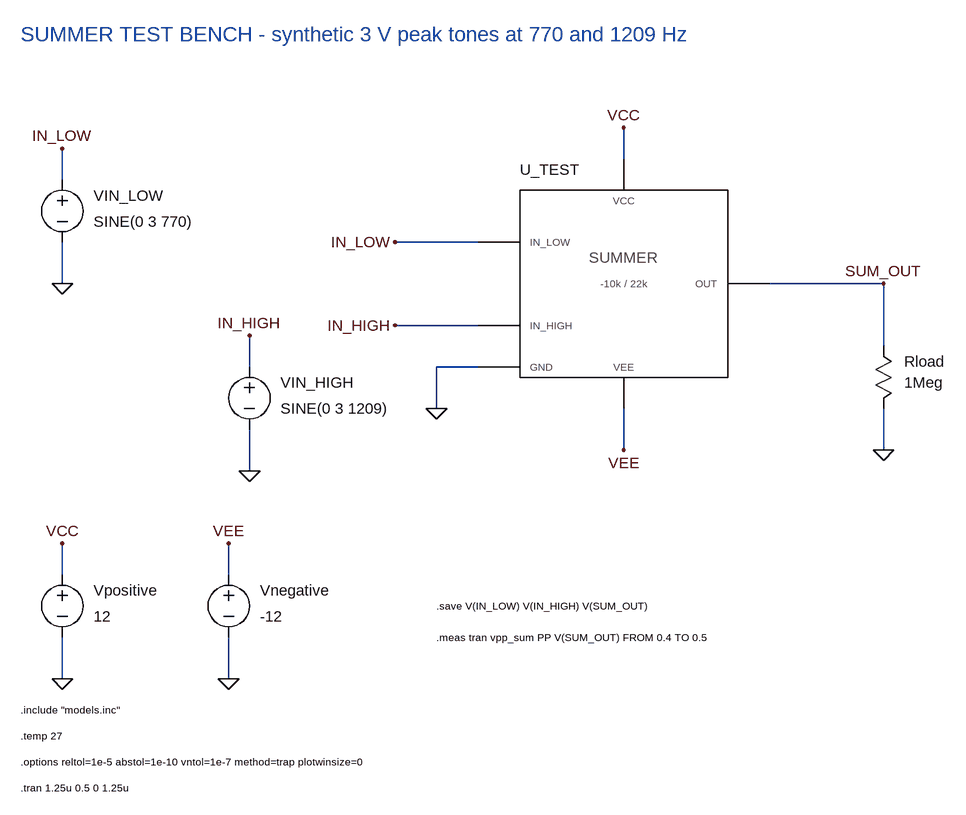
[diagram p0: schematic Test_SummingAmplifier.asc]
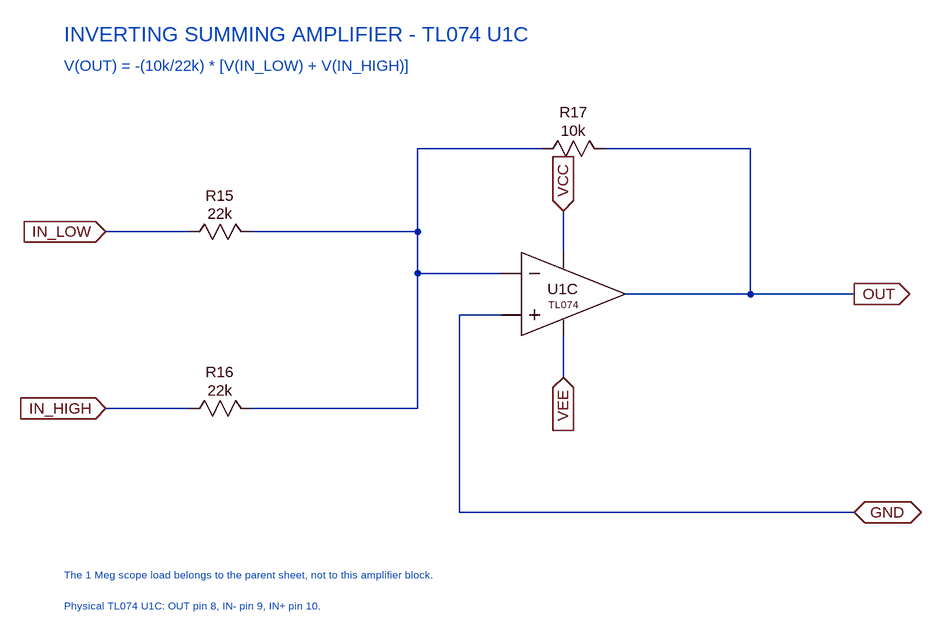
[diagram p1: sub-circuit summingamplifier.asc]
Test_SummingAmplifier.asc, the LTspice schematic file:
Version 4
SHEET 1 1856 1248
WIRE 992 208 992 160
WIRE 992 592 992 656
WIRE 768 528 704 528
WIRE 704 528 704 592
WIRE 128 240 128 192
WIRE 128 336 128 400
WIRE 416 528 416 480
WIRE 416 624 416 688
WIRE 768 336 640 336
WIRE 768 464 640 464
WIRE 1216 400 1392 400
WIRE 1392 400 1392 496
WIRE 1392 592 1392 656
WIRE 128 848 128 800
WIRE 128 944 128 1008
WIRE 384 848 384 800
WIRE 384 944 384 1008
FLAG 992 160 VCC
FLAG 992 656 VEE
FLAG 704 592 0
FLAG 128 192 IN_LOW
FLAG 128 400 0
FLAG 416 480 IN_HIGH
FLAG 416 688 0
FLAG 640 336 IN_LOW
FLAG 640 464 IN_HIGH
FLAG 1392 400 SUM_OUT
FLAG 1392 656 0
FLAG 128 800 VCC
FLAG 128 1008 0
FLAG 384 800 VEE
FLAG 384 1008 0
SYMBOL SummingAmplifier 832 256 R0
SYMATTR InstName U_TEST
SYMBOL V_Source 128 240 R0
SYMATTR InstName VIN_LOW
SYMATTR Value SINE(0 3 770)
SYMBOL V_Source 416 528 R0
SYMATTR InstName VIN_HIGH
SYMATTR Value SINE(0 3 1209)
SYMBOL R_V 1392 496 R0
SYMATTR InstName Rload
SYMATTR Value 1Meg
SYMBOL V_Source 128 848 R0
SYMATTR InstName Vpositive
SYMATTR Value 12
SYMBOL V_Source 384 848 R0
SYMATTR InstName Vnegative
SYMATTR Value -12
TEXT 64 16 Left 3 ;SUMMER TEST BENCH - synthetic 3 V peak tones at 770 and 1209 Hz
TEXT 64 1056 Left 1 !.include "models.inc"
TEXT 64 1096 Left 1 !.temp 27
TEXT 64 1136 Left 1 !.options reltol=1e-5 abstol=1e-10 vntol=1e-7 method=trap plotwinsize=0
TEXT 64 1176 Left 1 !.tran 1.25u 0.5 0 1.25u
TEXT 704 896 Left 1 !.save V(IN_LOW) V(IN_HIGH) V(SUM_OUT)
TEXT 704 944 Left 1 !.meas tran vpp_sum PP V(SUM_OUT) FROM 0.4 TO 0.5

summingamplifier.asc, the sub-circuit schematic file:
Version 4
SHEET 1 1472 1008
WIRE 928 416 1120 416
WIRE 1120 416 1280 416
WIRE 1120 416 1120 192
WIRE 1120 192 896 192
WIRE 800 192 608 192
WIRE 608 192 608 384
WIRE 608 384 736 384
WIRE 128 320 256 320
WIRE 352 320 608 320
WIRE 128 592 256 592
WIRE 352 592 608 592
WIRE 608 592 608 384
WIRE 736 448 672 448
WIRE 672 448 672 752
WIRE 672 752 1280 752
WIRE 832 352 832 288
WIRE 832 480 832 544
FLAG 1280 416 OUT
FLAG 128 320 IN_LOW
FLAG 128 592 IN_HIGH
FLAG 1280 752 GND
FLAG 832 288 VCC
FLAG 832 544 VEE
IOPIN 1280 416 Out
IOPIN 128 320 In
IOPIN 128 592 In
IOPIN 1280 752 BiDir
IOPIN 832 288 In
IOPIN 832 544 In
SYMBOL TL074_Channel 736 352 R0
SYMATTR InstName U1C
SYMBOL R_H 800 192 R0
SYMATTR InstName R17
SYMATTR Value 10k
SYMBOL R_H 256 320 R0
SYMATTR InstName R15
SYMATTR Value 22k
SYMBOL R_H 256 592 R0
SYMATTR InstName R16
SYMATTR Value 22k
TEXT 64 16 Left 3 ;INVERTING SUMMING AMPLIFIER - TL074 U1C
TEXT 64 64 Left 2 ;V(OUT) = -(10k/22k) * [V(IN_LOW) + V(IN_HIGH)]
TEXT 64 848 Left 1 ;The 1 Meg scope load belongs to the parent sheet, not to this amplifier block.
TEXT 64 896 Left 1 ;Physical TL074 U1C: OUT pin 8, IN- pin 9, IN+ pin 10.

The netlist it stands for:
* Test_SummingAmplifier.asc
XU_TEST IN_LOW IN_HIGH SUM_OUT VCC VEE 0 summingamplifier
VIN_LOW IN_LOW 0 SINE(0 3 770)
VIN_HIGH IN_HIGH 0 SINE(0 3 1209)
Rload SUM_OUT 0 1Meg
Vpositive VCC 0 12
Vnegative VEE 0 -12

* block symbol definitions
.subckt summingamplifier IN_LOW IN_HIGH OUT VCC VEE GND
XU1C GND N001 VCC VEE OUT TL074  ; pins IN+ IN- VCC VEE OUT
R17 N001 OUT 10k
R15 IN_LOW N001 22k
R16 IN_HIGH N001 22k
* INVERTING SUMMING AMPLIFIER - TL074 U1C
* V(OUT) = -(10k/22k) * [V(IN_LOW) + V(IN_HIGH)]
* The 1 Meg scope load belongs to the parent sheet, not to this amplifier block.
* Physical TL074 U1C: OUT pin 8, IN- pin 9, IN+ pin 10.
.ends summingamplifier

* SUMMER TEST BENCH - synthetic 3 V peak tones at 770 and 1209 Hz
.include "models.inc"
.temp 27
.options reltol=1e-5 abstol=1e-10 vntol=1e-7 method=trap plotwinsize=0
.tran 1.25u 0.5 0 1.25u
.save V(IN_LOW) V(IN_HIGH) V(SUM_OUT)
.meas tran vpp_sum PP V(SUM_OUT) FROM 0.4 TO 0.5
.backanno
.end